# Altium schematic sheet PhototransistorAmbient Light Indicator.SchDoc
size A
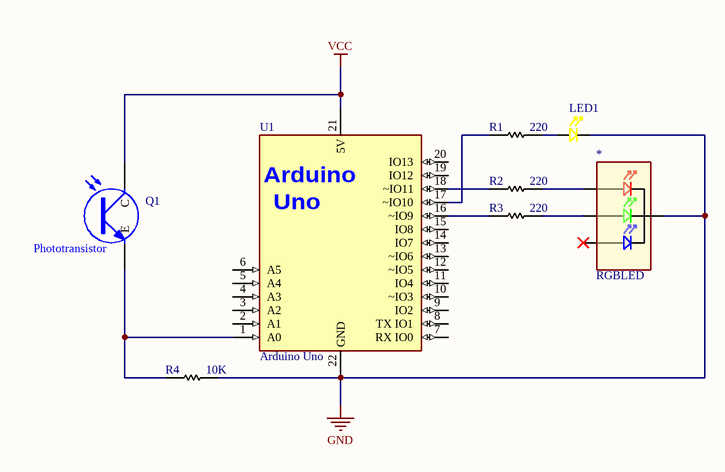
[diagram p0: PhototransistorAmbient Light Indicator.SchDoc]

## Parts
*  RGBLED
LED1  YellowLED  (value not drawn)
Q1  1540032NA3090  [WL-TTRW_D3.85H5.3]  (value not drawn)
R1  220
R2  220
R3  220
R4  10K
U1  Arduino Uno

## Nets
GND: *.4 LED1.10 R4.7 U1.22(GND)
VCC: Q1.1(C) U1.21(5V)
Net*_1: *.1(Red) R2.7
Net*_2: *.2(Green) R3.7
NetLED1_9: LED1.9 R1.7
NetQ1_2: Q1.2(E) R4.8 U1.1(A0)
NetR1_8: R1.8 U1.17(~IO10)
NetR2_8: R2.8 U1.18(~IO11)
NetR3_8: R3.8 U1.16(~IO9)

Not connected (* = marked no-connect by the designer): * 3(Blue)*; U1 2(A1) 3(A2) 4(A3) 5(A4) 6(A5) 7(RX_IO0) 8(TX_IO1) 9(IO2) 10(~IO3) 11(IO4) 12(~IO5) 13(~IO6) 14(IO7) 15(IO8) 19(IO12) 20(IO13)

## Notes on the sheet
- (near Q1) Phototransistor
- (in symbol Arduino Uno) Arduino; Uno

## Library data of the parts
Q1 = CMP-03913-108242135-2: Phototransistor, 850Nm, T-1 Rohs Compliant: Yes; Manufacturer Lifecycle Status: ACTIVE; Viewing Angle: 30°; Max Collector Current: 15mA; YEOL: 1 = Estimated lifetime > 10 years; RoHS: Compliant; Width: 3.8mm; Min Operating Temperature: -40°C; Lifecycle Status: Production; Height: 8.7mm; Max Operating Temperature: 85°C; Length: 3mm
R1-R4 = 220R